# Altium schematic sheet DIGITAL INPUTS.SchDoc
size A3; Date: 10/10/2026; DrawnBy: Juan Alejandro Villodres Perdomo; Revision: 0.1; SheetNumber: 5; SheetTotal: 5; ENG_APP_DATE: --/--/--; DSN_APP_DATE: --/--/--; CHK_APP_DATE: --/--/--
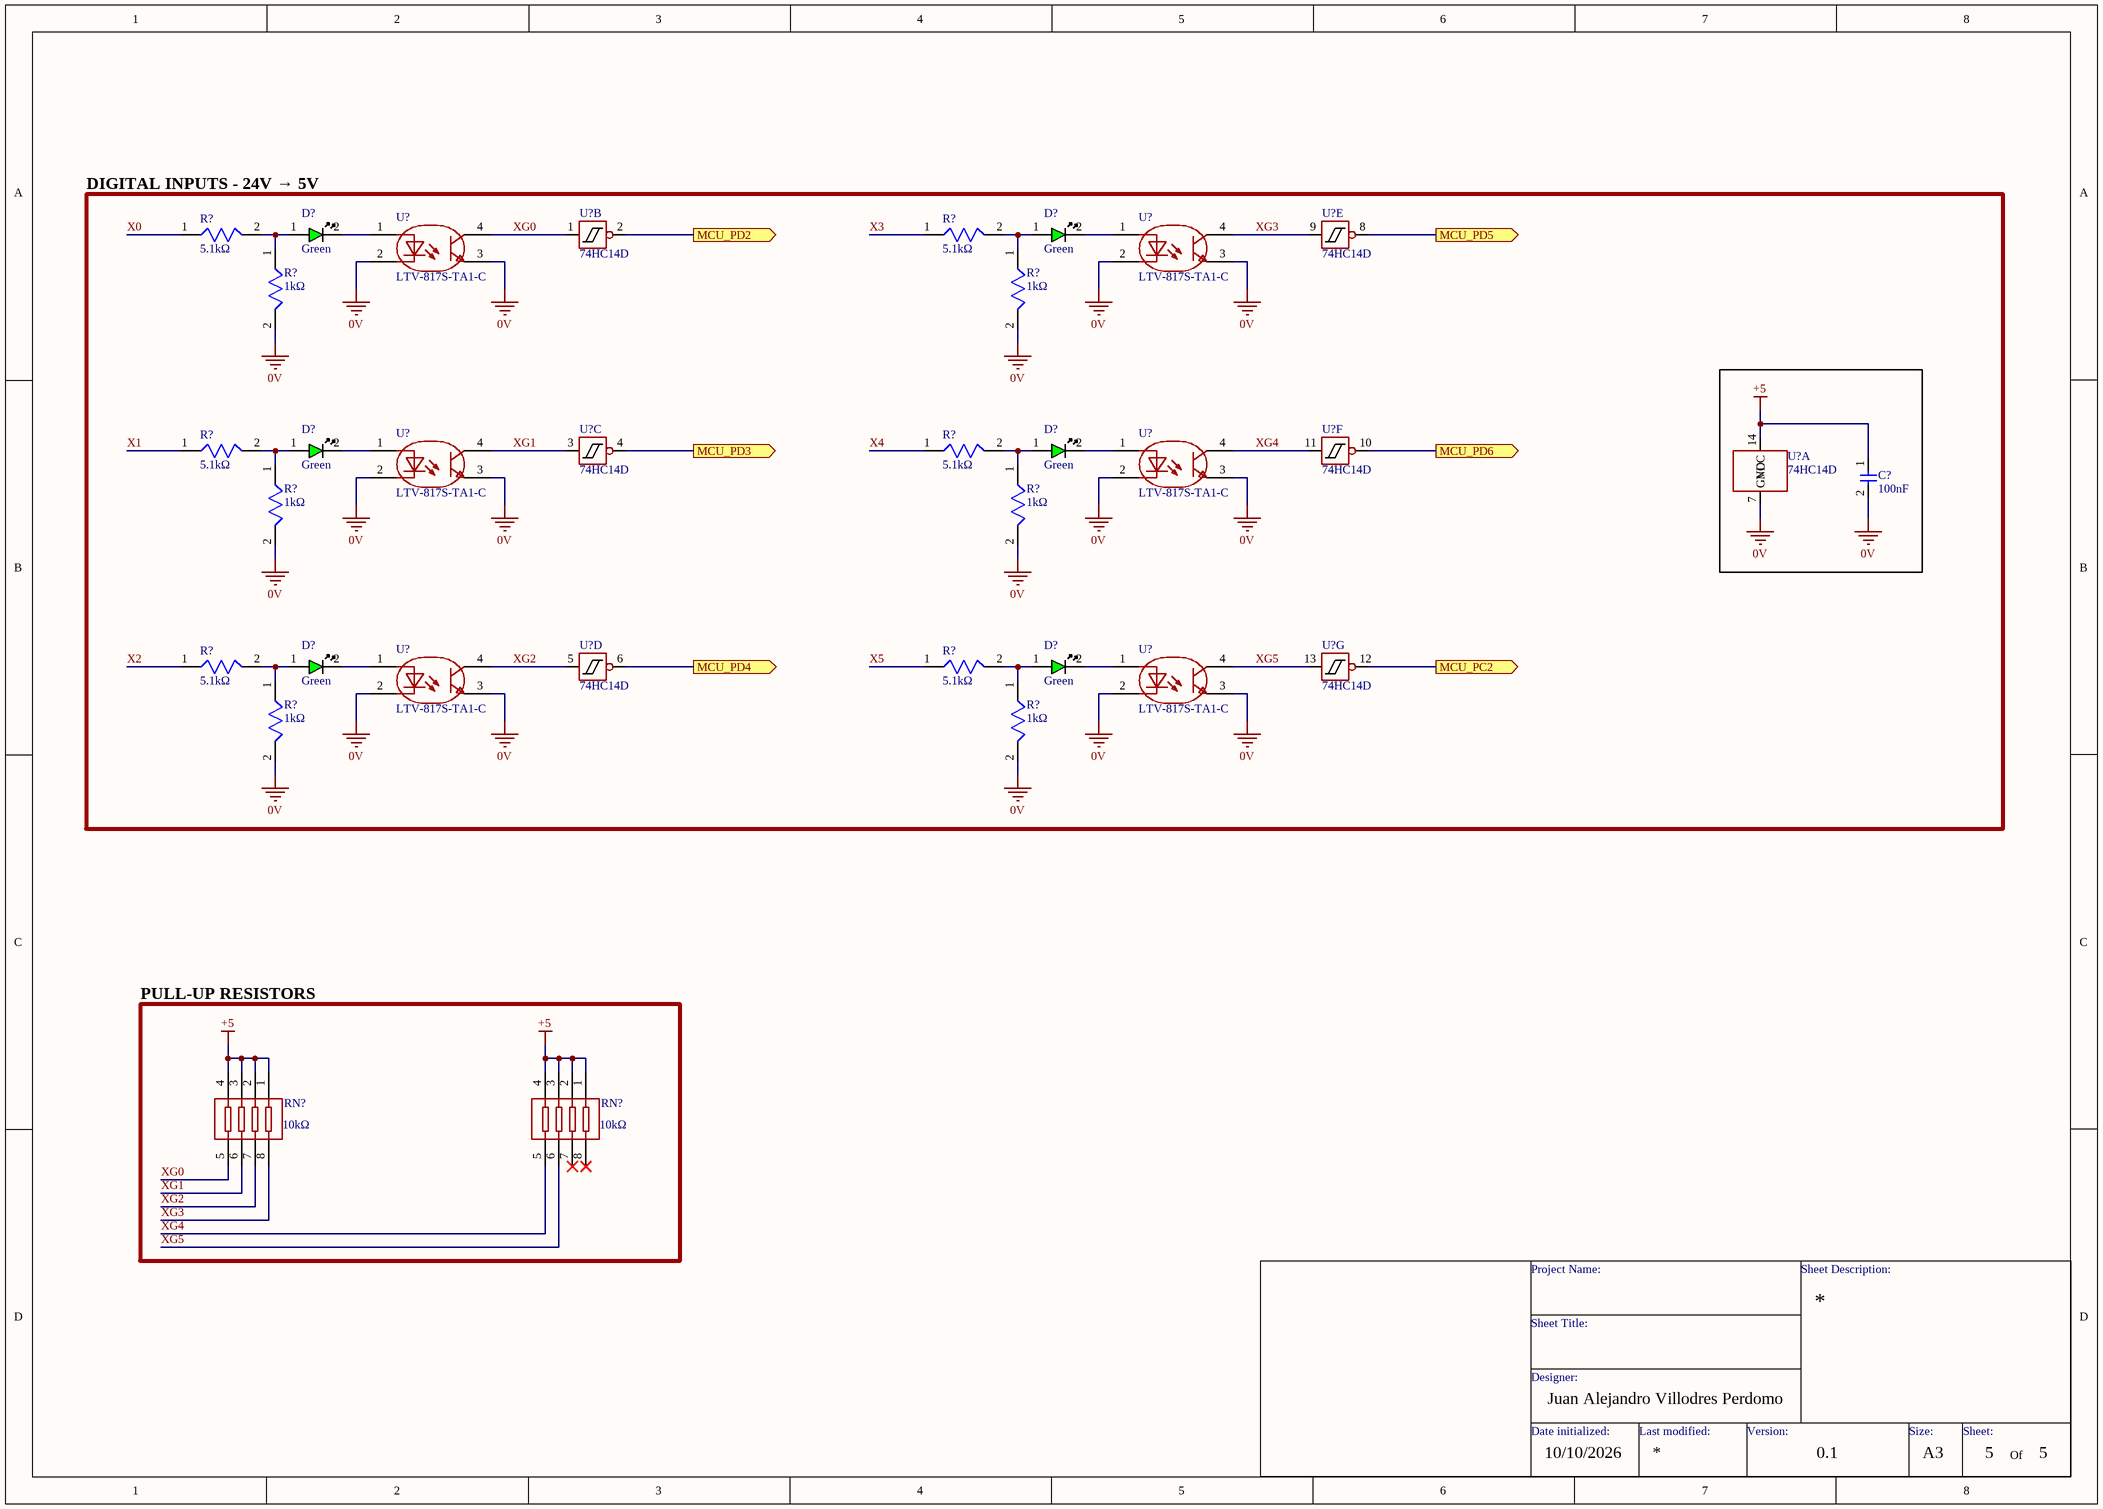
[diagram p0: DIGITAL INPUTS.SchDoc]

## Parts
(Parts that share a designator on the sheet are numbered #1, #2 ... from top to bottom, then left to right.)
C?  100nF  [CAPC1005X55L]
D?#1  Green  [LED0805-R-RD]
D?#2  Green  [LED0805-R-RD]
D?#3  Green  [LED0805-R-RD]
D?#4  Green  [LED0805-R-RD]
D?#5  Green  [LED0805-R-RD]
D?#6  Green  [LED0805-R-RD]
R?#1  5.1kΩ  [RESC1005X37L]
R?#2  5.1kΩ  [RESC1005X37L]
R?#3  1kΩ  [RESC1005X37L]
R?#4  1kΩ  [RESC1005X37L]
R?#5  5.1kΩ  [RESC1005X37L]
R?#6  5.1kΩ  [RESC1005X37L]
R?#7  1kΩ  [RESC1005X37L]
R?#8  1kΩ  [RESC1005X37L]
R?#9  5.1kΩ  [RESC1005X37L]
R?#10  5.1kΩ  [RESC1005X37L]
R?#11  1kΩ  [RESC1005X37L]
R?#12  1kΩ  [RESC1005X37L]
RN?#1  10kΩ  [RES-ARRAY-SMD_0603-8P-L3.2-W1.6-BL]
RN?#2  10kΩ  [RES-ARRAY-SMD_0603-8P-L3.2-W1.6-BL]
U?#1  74HC14D  [SOIC-14_L8.7-W3.9-P1.27-LS6.0-BL]  (part B of 7)
U?#2  74HC14D  [SOIC-14_L8.7-W3.9-P1.27-LS6.0-BL]  (part E of 7)
U?#3  LTV-817S-TA1-C  [OPTO-SMD-4_L4.6-W6.5-P2.54-LS10.3-BL]
U?#4  LTV-817S-TA1-C  [OPTO-SMD-4_L4.6-W6.5-P2.54-LS10.3-BL]
U?#5  74HC14D  [SOIC-14_L8.7-W3.9-P1.27-LS6.0-BL]  (part A of 7)
U?#6  74HC14D  [SOIC-14_L8.7-W3.9-P1.27-LS6.0-BL]  (part C of 7)
U?#7  74HC14D  [SOIC-14_L8.7-W3.9-P1.27-LS6.0-BL]  (part F of 7)
U?#8  LTV-817S-TA1-C  [OPTO-SMD-4_L4.6-W6.5-P2.54-LS10.3-BL]
U?#9  LTV-817S-TA1-C  [OPTO-SMD-4_L4.6-W6.5-P2.54-LS10.3-BL]
U?#10  74HC14D  [SOIC-14_L8.7-W3.9-P1.27-LS6.0-BL]  (part D of 7)
U?#11  74HC14D  [SOIC-14_L8.7-W3.9-P1.27-LS6.0-BL]  (part G of 7)
U?#12  LTV-817S-TA1-C  [OPTO-SMD-4_L4.6-W6.5-P2.54-LS10.3-BL]
U?#13  LTV-817S-TA1-C  [OPTO-SMD-4_L4.6-W6.5-P2.54-LS10.3-BL]

## Blocks framed on the sheet
DIGITAL INPUTS - 24V → 5V: C? D?#1-D?#6 R?#1-R?#12 U?#1-U?#13
PULL-UP RESISTORS: RN?#1 RN?#2

## Ports
MCU_PC2 (out), MCU_PD2 (out, see MCU[3C]), MCU_PD3 (out, see MCU[3C]), MCU_PD4 (out, see MCU[3C]), MCU_PD5 (out, see MCU[3C]), MCU_PD6 (out, see MCU[3C])

## Nets
0V: C?.2 R?#3.2 R?#4.2 R?#7.2 R?#8.2 R?#11.2 R?#12.2 U?#3.2 U?#3.3 U?#4.2 U?#4.3 U?#5.7(GND) U?#8.2 U?#8.3 U?#9.2 U?#9.3 U?#12.2 U?#12.3 U?#13.2 U?#13.3
+5: C?.1 RN?#1.1 RN?#1.2 RN?#1.3 RN?#1.4 RN?#2.1 RN?#2.2 RN?#2.3 RN?#2.4 U?#5.14(VCC)
MCU_PC2: U?#11.12(6Y) ; port MCU_PC2
MCU_PD2: U?#1.2(1Y) ; port MCU_PD2
MCU_PD3: U?#6.4(2Y) ; port MCU_PD3
MCU_PD4: U?#10.6(3Y) ; port MCU_PD4
MCU_PD5: U?#2.8(4Y) ; port MCU_PD5
MCU_PD6: U?#7.10(5Y) ; port MCU_PD6
X0: R?#1.1
X1: R?#5.1
X2: R?#9.1
X3: R?#2.1
X4: R?#6.1
X5: R?#10.1
XG0: RN?#1.5 U?#1.1(1A) U?#3.4
XG1: RN?#1.6 U?#6.3(2A) U?#8.4
XG2: RN?#1.7 U?#10.5(3A) U?#12.4
XG3: RN?#1.8 U?#2.9(4A) U?#4.4
XG4: RN?#2.5 U?#7.11(5A) U?#9.4
XG5: RN?#2.6 U?#11.13(6A) U?#13.4
NetD?#1_1: D?#1.1(A) R?#1.2 R?#3.1
NetD?#1_2: D?#1.2(K) U?#3.1
NetD?#2_1: D?#2.1(A) R?#2.2 R?#4.1
NetD?#2_2: D?#2.2(K) U?#4.1
NetD?#3_1: D?#3.1(A) R?#5.2 R?#7.1
NetD?#3_2: D?#3.2(K) U?#8.1
NetD?#4_1: D?#4.1(A) R?#6.2 R?#8.1
NetD?#4_2: D?#4.2(K) U?#9.1
NetD?#5_1: D?#5.1(A) R?#9.2 R?#11.1
NetD?#5_2: D?#5.2(K) U?#12.1
NetD?#6_1: D?#6.1(A) R?#10.2 R?#12.1
NetD?#6_2: D?#6.2(K) U?#13.1

Not connected (* = marked no-connect by the designer): RN?#2 7* 8*

## Notes on the sheet
- Project Name:
- Sheet Description:
- Sheet Title:
- Designer:
- Date initialized:
- Last modified:
- Version:
- Size:
- A3
- Sheet:
- Of

## Library data of the parts
C? = CAP_0402_16V: Capacitor SMD 0402 / 100nF / 16V; SupplierPart: C1525
D?#1-D?#6 = LED_0805_GREEN: Lamp Holder Type:2mm x 1.25mm square LED Illumination Color:Emerald Green Voltage - Forward(Vf):2.6V~3.1V Voltage - Forward(Vf):2.6V~3.1V Power(Watts):100mW Forward Current:5mA Wavelength - Dominant:513nm~528nm Wavelength - Dominant:513nm~528nm Peak Wavel; Manufacturer: KENTO; Symbol: 0805G (Green); Device: KT-0805G; AddInBom: yes; ModelId: 167045bb0eae412b9d5564860e113a91ÂŽ0819f05c4eef4c71ace90d822a990e87; ModelName: LED0805-RD; ModelTransform: 79.527,49.2125,0,0,0,0,0,0,0; Power(Watts): 100mW; Forward Current: 5mA; Peak Wavelength: 525nm; Diode Configuration: Discrete Diode; Lens Color: Water Clear; Luminous Intensity: 430mcd; Viewing Angle: 120°; LCSC Part Name: 0805 翠绿 高亮; SupplierPart: C2297; ManufacturerPart: KT-0805G; Supplier Footprint: 0805; JLCPCB Part Class: Basic Part; Datasheet: https://item.szlcsc.com/datasheet/KT-0805G/2670.html; Supplier: LCSC; ConvertToPcb: yes; FootprintName: LED0805-R-RD; Lamp Holder Type: 2mm x 1.25mm square LED; Illumination Color: Emerald Green; Voltage - Forward(Vf): 2.6V~3.1V; Wavelength - Dominant: 513nm~528nm; Color Temperature: -; Mounting Style: -; Operating Temperature: -40℃~+85℃
R?#1 R?#2 R?#5 R?#6 R?#9 R?#10 = RES_0402: Resistor SMD 0402 / 5.1kΩ / 62.5mW; SupplierPart: C25905
R?#3 R?#4 R?#7 R?#8 R?#11 R?#12 = RES_0402: Resistor SMD 0402 / 1kΩ / 62.5mW; SupplierPart: C11702
RN?#1 RN?#2 = RES_ARR_10K_4R: Number of Resistors: Resistance:10kΩ Tolerance:±5% Tolerance:±5% Power(Watts): Temperature Coefficient:±200ppm/℃ Temperature Coefficient:±200ppm/℃ Number of Pins:; Manufacturer: UNI-ROYAL(厚声); Symbol: 4D03WGJ0103T5E; AddInBom: yes; ModelId: f69be69e059e4cc5aff0aa4aef49046eÂŽ0819f05c4eef4c71ace90d822a990e87; ModelName: R0603-8P_L3.2-W1.6-H0.6; ModelTransform: 125.984,62.992,0,0,0,0,0,0,0; Tolerance: ±5%; Device: 4D03WGJ0103T5E; LCSC Part Name: 10kΩ ±5%; SupplierPart: C29718; ManufacturerPart: 4D03WGJ0103T5E; Supplier Footprint: 0603x4; JLCPCB Part Class: Basic Part; Datasheet: https://atta.szlcsc.com/upload/public/pdf/source/20191224/C474318_2527498AE30E813171187CCD28401A71.pdf; Supplier: LCSC; ConvertToPcb: yes; FootprintName: RES-ARRAY-SMD_0603-8P-L3.2-W1.6-BL; Value: 10kΩ; Temperature Coefficient: ±200ppm/℃
U?#1 U?#2 U?#5-U?#7 U?#10 U?#11 = 74HC14D: -40℃~+125℃ 1 1.5V~4.2V 21ns@6V,50pF 2V~6V 2uA 300mV~1.2V 5.2mA 5.2mA 6 74HC Schmitt trigger SOIC-14 Inverters ROHS; SupplierPart: C5605
U?#3 U?#4 U?#8 U?#9 U?#12 U?#13 = LTV-817S-TA1-C: Input type:DC Output Type:Phototransistor Voltage - Forward(Vf):1.2V Output Current:50mA Isolation Voltage(Vrms):5kV Reverse Voltage:6V Load Voltage:35V Number of Outputs:1 Vce Saturation(VCE(sat)):100mV@1mA,20mA Rise time:4us@2mA,100Ω Fall time:3us Opera; Manufacturer: LITEON(光宝); AddInBom: yes; ModelId: 9d4cded8570a44bda9996ea26f6726e5ÂŽ0819f05c4eef4c71ace90d822a990e87; ModelName: OPTO-SMD-4_L4.6-W6.5-H3.6-LS10.2-P2.54; ModelTransform: 401.574,181.102,0,90,0,0,0,0,0; Input type: DC; Voltage - Forward(Vf): 1.2V; Output Current: 50mA; Isolation Voltage(Vrms): 5kV; Reverse Voltage: 6V; Load Voltage: 35V; Number of Outputs: 1; Fall time: 3us; Current Transfer Ratio (CTR) Minimum: 50%; Current Transfer Ratio (CTR) Maximum/Saturation Value: 600%; Symbol: LTV-817S-TA1-C; Device: LTV-817S-TA1-C; LCSC Part Name: DC输入 隔离电压(rms):5000V; SupplierPart: C109227; ManufacturerPart: LTV-817S-TA1-C; Supplier Footprint: SMD-4P; JLCPCB Part Class: Basic Part; Datasheet: https://item.szlcsc.com/datasheet/LTV-817S-TA1-C/110448.html; Supplier: LCSC; ConvertToPcb: yes; FootprintName: OPTO-SMD-4_L4.6-W6.5-P2.54-LS10.3-BL; Output Type: Phototransistor; Vce Saturation(VCE(sat)): 100mV@1mA,20mA; Rise time: 4us@2mA,100Ω; Operating Temperature: -30℃~+110℃; Forward Current(If): 50mA; Features: -